# Altium schematic sheet Audio.SchDoc
size A; SheetNumber: 5; SheetTotal: 6
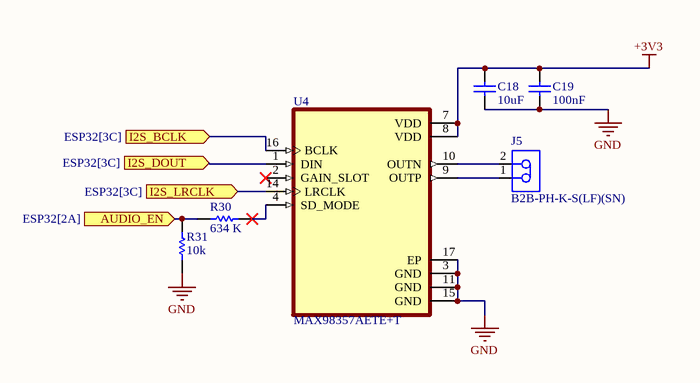
[diagram p0: Audio.SchDoc]

## Parts
C18  value 10uF  [CAP 1206_3216]  (hidden comment: Capacitor)
C19  value 100nF  [CAP 1206_3216]  (hidden comment: Capacitor)
J5  B2B-PH-K-S(LF)(SN)  [JST-B2B-PH-K-S_V]
R30  value 634 K  [RES 0805_2012]  (hidden comment: Resistor)
R31  value 10k  [RES 0805_2012]  (hidden comment: Resistor)
U4  MAX98357AETE+T  [QFN50P300X300X80-17N]

## Ports
AUDIO_EN (in, see ESP32[2A]), I2S_BCLK (in, see ESP32[3C]), I2S_DOUT (in, see ESP32[3C]), I2S_LRCLK (in, see ESP32[3C])

## Nets
+3V3: C18.2 C19.2 U4.7(VDD) U4.8(VDD)
GND: C18.1 C19.1 R31.2 U4.3(GND) U4.11(GND) U4.15(GND) U4.17(EP)
AUDIO_EN: R30.2 R31.1 ; port AUDIO_EN
I2S_BCLK: U4.16(BCLK) ; port I2S_BCLK
I2S_DOUT: U4.1(DIN) ; port I2S_DOUT
I2S_LRCLK: U4.14(LRCLK) ; port I2S_LRCLK
NetJ5_1: J5.1 U4.9(OUTP)
NetJ5_2: J5.2 U4.10(OUTN)
NetR30_1: R30.1 U4.4(SD_MODE)

Not connected (* = marked no-connect by the designer): U4 2(GAIN_SLOT)*

## Notes on the sheet
- Title:
- Date:
- Size:
- A3
- Number:
- Institution:
- Universidad Anáhuac Querétaro
- Drawn by:
- Marco Antonio Guereca Soto
- Check by:
- Morrison Ernesto Rodríguez Gutiérrez

## Library data of the parts
C18 C19 = Capacitor: SimulationGenericComponent: True
J5 = CMP-2000-05162-1: Male Header, Pitch 2 mm, 1 x 2 Position, Height 6 mm, Tail Length 3.4 mm, -25 to 85 degC, RoHS, Bulk; Manufacturer: JST; Pitch: 2mm; Style/Orientation: StraightHeader/Plug; No of Positions: 2; Datasheet Version: Nov-08; Datasheet URL: http://datasheet.octopart.com/B2B-PH-K-S%28LF%29%28SN%29-JST-datasheet-8324864.pdf; Manufacturer URL: http://www.jst.com/home2.html; Type: ShroudedHeader; Termination: Crimp
R30 R31 = Resistor: TC1: 0; SimulationGenericComponent: True; TC2: 0
U4 = MAX98357AETE+T: Tiny, Low-Cost, PCM Class D Amplifier with Class AB Performance; MF: Analog Devices; SnapEDA_Link: https://www.snapeda.com/parts/MAX98357AETE+T/Analog+Devices/view-part/?ref=snap; Package: TQFN-16 Maxim; Value: *; MP: MAX98357AETE+T; Check_prices: https://www.snapeda.com/parts/MAX98357AETE+T/Analog+Devices/view-part/?ref=eda